# Altium schematic sheet Input.SchDoc
size A4; SheetNumber: 8; SheetTotal: 9
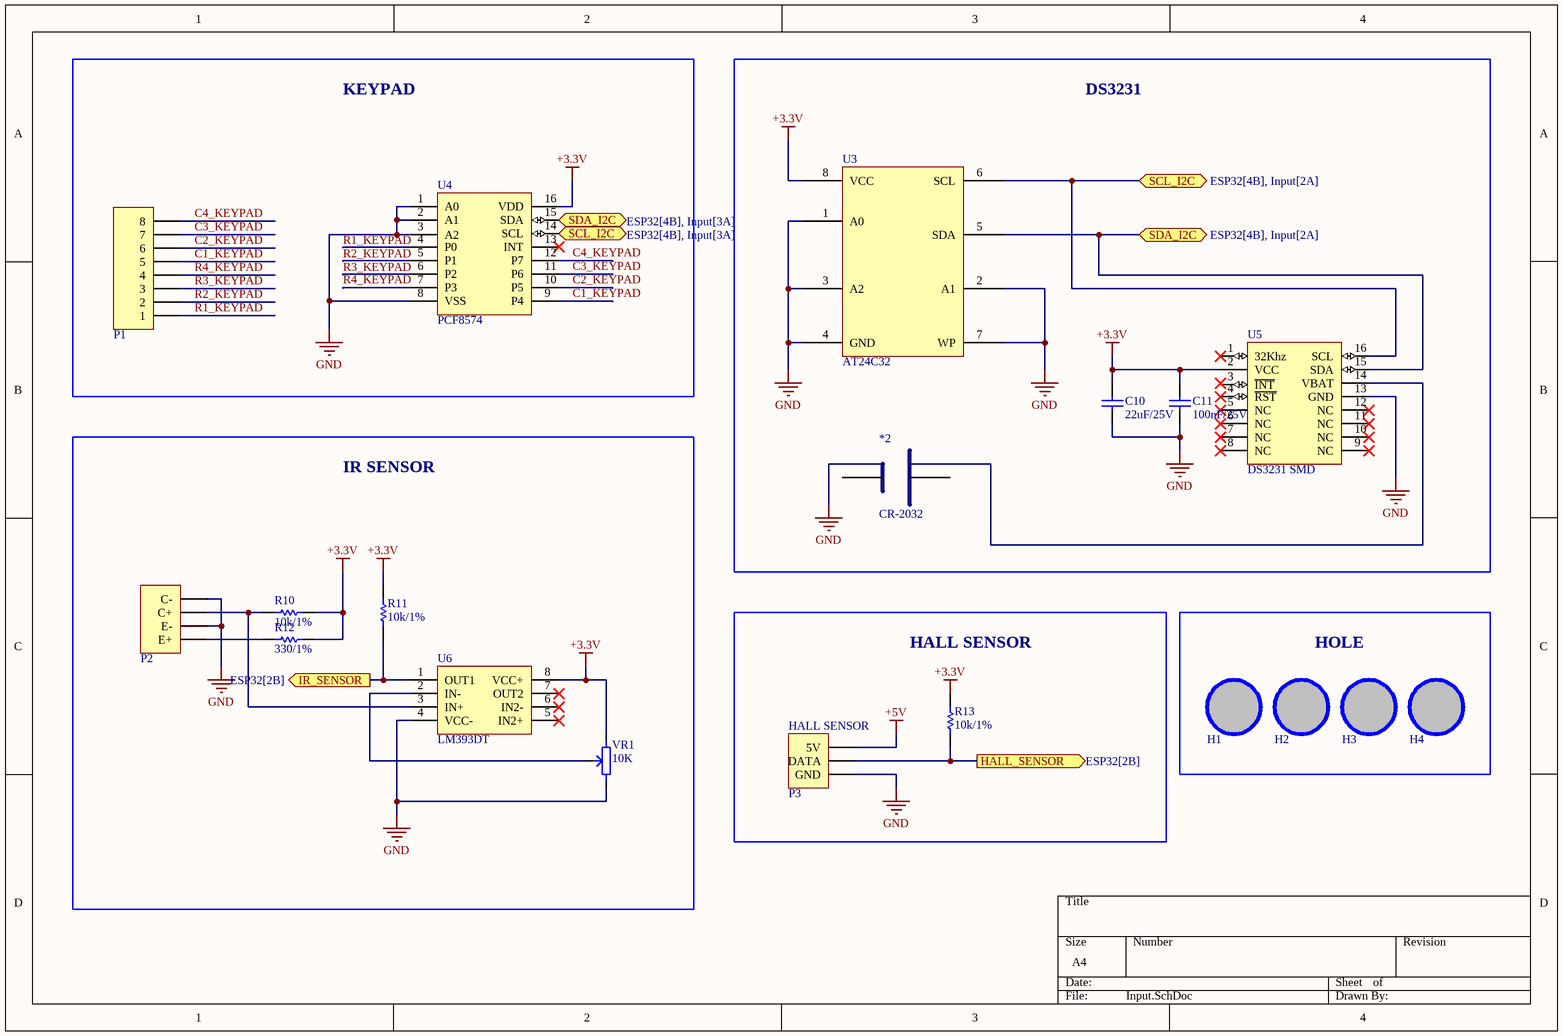
[diagram p0: Input.SchDoc]

## Parts
*2  CR-2032  [CR-2032]
C10  value 22uF/25V  [CAP-SM-0805]  (hidden comment: Cap Non-Pol SMD)
C11  value 100nF/25V  [CAP-SM-0805]  (hidden comment: Cap Non-Pol SMD)
H1  Hole  [LO KHOAN 3MM]  (value not drawn)
H2  Hole  [LO KHOAN 3MM]  (value not drawn)
H3  Hole  [LO KHOAN 3MM]  (value not drawn)
H4  Hole  [LO KHOAN 3MM]  (value not drawn)
P1  Header 8  [JP8]  (value not drawn)
P2  Header 4  [JP4]  (value not drawn)
P3  HALL SENSOR  [JP3]
R10  value 10k/1%  [RES-SM-0805]  (hidden comment: RESISTOR SMD)
R11  value 10k/1%  [RES-SM-0805]  (hidden comment: RESISTOR SMD)
R12  value 330/1%  [RES-SM-0805]  (hidden comment: RESISTOR SMD)
R13  value 10k/1%  [RES-SM-0805]  (hidden comment: RESISTOR SMD)
U3  AT24C32  [LM555CMX]
U4  PCF8574  [SOIC 16]
U5  DS3231 SMD  [SOIC 16]
U6  LM393DT  [SOIC8_50_328_25X90_SMT]
VR1  10K  [Bien Tro Tam Giac Dung]

## Blocks framed on the sheet
KEYPAD: P1 U4
DS3231: *2 C10 C11 U3 U5
IR SENSOR: P2 R10-R12 U6 VR1
HALL SENSOR: P3 R13
HOLE: H1-H4

## Ports
HALL_SENSOR (out, see ESP32[2B]), IR_SENSOR (out, see ESP32[2B]), SCL_I2C (bidir, see ESP32[4B], Input[2A]), SCL_I2C (bidir, see ESP32[4B], Input[3A]), SDA_I2C (bidir, see ESP32[4B], Input[2A]), SDA_I2C (bidir, see ESP32[4B], Input[3A])

## Nets
+3.3V: C10.1 C11.1 R10.2 R11.2 R12.2 R13.2 U3.8(VCC) U4.16(VDD) U5.2(VCC) U6.8(VCC+) VR1.3
+5V: P3.1(5V)
GND: *2.2 C10.2 C11.2 P2.2(E-) P2.4(C-) P3.3(GND) U3.1(A0) U3.2(A1) U3.3(A2) U3.4(GND) U3.7(WP) U4.1(A0) U4.2(A1) U4.3(A2) U4.8(VSS) U5.13(GND) U6.4(VCC-) VR1.1
C1_KEYPAD: P1.5 U4.9(P4)
C2_KEYPAD: P1.6 U4.10(P5)
C3_KEYPAD: P1.7 U4.11(P6)
C4_KEYPAD: P1.8 U4.12(P7)
HALL_SENSOR: P3.2(DATA) R13.1 ; port HALL_SENSOR
IR_SENSOR: R11.1 U6.1(OUT1) ; port IR_SENSOR
R1_KEYPAD: P1.1 U4.4(P0)
R2_KEYPAD: P1.2 U4.5(P1)
R3_KEYPAD: P1.3 U4.6(P2)
R4_KEYPAD: P1.4 U4.7(P3)
SCL_I2C: U3.6(SCL) U4.14(SCL) U5.16(SCL) ; port SCL_I2C
SDA_I2C: U3.5(SDA) U4.15(SDA) U5.15(SDA) ; port SDA_I2C
Net*2_1: *2.1 U5.14(VBAT)
NetP2_1: P2.1(E+) R12.1
NetP2_3: P2.3(C+) R10.1 U6.3(IN+)
NetU6_2: U6.2(IN-) VR1.2

Not connected (* = marked no-connect by the designer): H1 1; H2 1; H3 1; H4 1; U4 13(INT)*; U5 1(32Khz)* 3(~{INT}) 4(~{RST})* 5(NC)* 6(NC)* 7(NC)* 8(NC)* 9(NC)* 10(NC)* 11(NC)* 12(NC)*; U6 5(IN2+)* 6(IN2-)* 7(OUT2)*

## Library data of the parts
C10 C11 = Cap Non-Pol SMD: Capacitor
H1-H4 = Hole: Hole 3mm
P1 = Header 8: Header, 8-Pin; LatestRevisionDate: 17-Jul-2002; LatestRevisionNote: Re-released for DXP Platform.; Publisher: Altium Limited
P2 = Header 4: Header, 4-Pin; LatestRevisionDate: 17-Jul-2002; LatestRevisionNote: Re-released for DXP Platform.; Publisher: Altium Limited
P3 = Header 3: Header, 3-Pin; LatestRevisionDate: 17-Jul-2002; LatestRevisionNote: Re-released for DXP Platform.; Publisher: Altium Limited
R10-R13 = RESISTOR SMD: Resistor
U3 = LM555CMX: Timers & Support Products TIMER; Manufacturer: Texas Instruments; Manufacturer Part Number: LM555CMX/NOPB; Pad count: 8; Supply Voltage - Max: 4.5 V; Supply Voltage - Min: 16 V; Number of Internal Timers: 1; Power Dissipation: 1.18 W; Active: Active; ComponentLink1Description: Datasheet; ComponentLink1URL: https://www.ti.com/lit/gpn/lm555; LCSC Part #: N/A; Mount: SMD/SMT; Operating Temperature Max: + 85 C; Operating Temperature Min: - 40 C; Package / Case: SOIC-8; Packaging: Tape and Reel; Supplier 1: Mouser; Supplier 1 Part Number: 926-LM555CMX/NOPB; Supplier 1 URL: https://www.mouser.com/ProductDetail/Texas-Instruments/LM555CMX-NOPB?qs=QbsRYf82W3GHnQuoL%2FmIoA%3D%3D; Supplier 2: Digi-Key; Supplier 2 Part Number: N/A; Supplier 2 URL: N/A; Supplier 3: thegioiic; Supplier 3 Part Number: NE555D; Supplier 3 URL: https://www.thegioiic.com/ne555d-ic-timer-circuit-100khz-8-soic; Value: LM555CMX
U4 U5 = DS3231 SMD: SOIC
U6 = IC_LM393DT: Comparator General Purpose CMOS, DTL, ECL, MOS, Open-Collector, TTL 8-SO; Manufacturer: Texas Instruments; Alternate Part Number-1: NA; Manufacturer Part Number: LM393DT; Case/Package: SOIC8; Supplier-1: ARROW; Supplier Part Number-1: LM393DT
VR1 = Bien tro tam giac 10K Dung: Cắm; Ma_Hang: MH000919; Don_Vi: Con; Ten_Linh_Kien: Biến Trở Tam Giác 103-10K RM065 (Chân Đứng); Chung_Loai: Cắm; Kieu_Chan: *